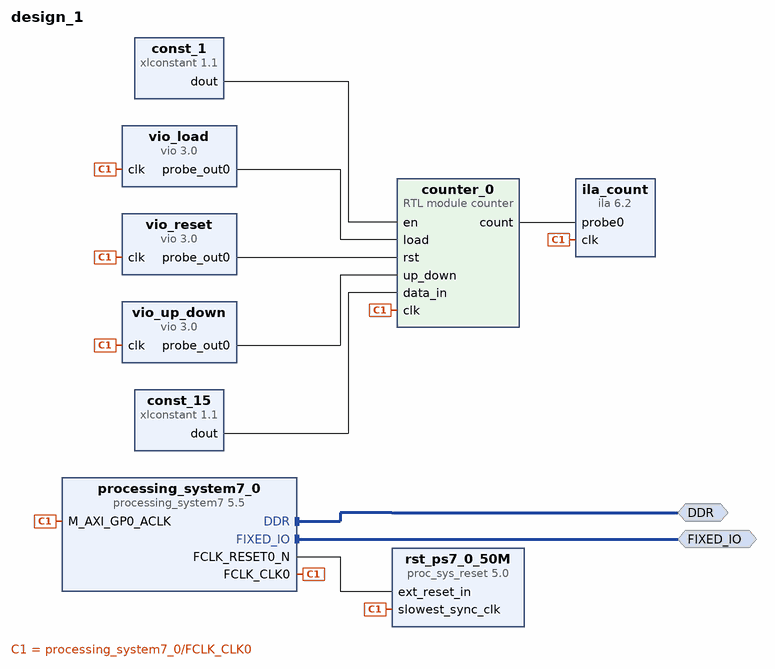
[diagram p0: block diagram of the top level]
# Vivado block design design_1, xc7z010clg400-1, Vivado 2026.1
create_bd_design design_1

create_bd_intf_port -mode Master -vlnv xilinx.com:interface:ddrx_rtl:1.0 DDR
create_bd_intf_port -mode Master -vlnv xilinx.com:display_processing_system7:fixedio_rtl:1.0 FIXED_IO

create_bd_cell -type module -reference counter counter_0
create_bd_cell -type ip -vlnv xilinx.com:ip:ila:6.2 ila_count
set_property -dict [list \
  CONFIG.C_EN_STRG_QUAL 1 \
  CONFIG.C_MONITOR_TYPE Native \
  CONFIG.C_NUM_OF_PROBES 1 \
  CONFIG.C_PROBE0_WIDTH 4 \
] [get_bd_cells ila_count]
create_bd_cell -type ip -vlnv xilinx.com:ip:xlconstant:1.1 const_1
create_bd_cell -type ip -vlnv xilinx.com:ip:xlconstant:1.1 const_15
set_property -dict {CONFIG.CONST_VAL 15 CONFIG.CONST_WIDTH 4} [get_bd_cells const_15]
create_bd_cell -type ip -vlnv xilinx.com:ip:vio:3.0 vio_up_down
set_property -dict {CONFIG.C_NUM_PROBE_IN 0} [get_bd_cells vio_up_down]
create_bd_cell -type ip -vlnv xilinx.com:ip:vio:3.0 vio_load
set_property -dict {CONFIG.C_NUM_PROBE_IN 0} [get_bd_cells vio_load]
create_bd_cell -type ip -vlnv xilinx.com:ip:processing_system7:5.5 processing_system7_0
# 1 more settings of processing_system7_0 are not shown: defaults, MIO pin electricals, DDR timing, and values the tool derives
create_bd_cell -type ip -vlnv xilinx.com:ip:proc_sys_reset:5.0 rst_ps7_0_50M
create_bd_cell -type ip -vlnv xilinx.com:ip:vio:3.0 vio_reset
set_property -dict {CONFIG.C_NUM_PROBE_IN 0} [get_bd_cells vio_reset]

# ---- connections ----

connect_bd_intf_net [get_bd_intf_ports DDR] [get_bd_intf_pins processing_system7_0/DDR]
connect_bd_intf_net [get_bd_intf_ports FIXED_IO] [get_bd_intf_pins processing_system7_0/FIXED_IO]
connect_bd_net -net clk_wiz_clk_out1 [get_bd_pins processing_system7_0/FCLK_CLK0] \
  [get_bd_pins counter_0/clk] [get_bd_pins ila_count/clk] [get_bd_pins vio_up_down/clk] [get_bd_pins vio_load/clk] \
  [get_bd_pins rst_ps7_0_50M/slowest_sync_clk] [get_bd_pins processing_system7_0/M_AXI_GP0_ACLK] [get_bd_pins vio_reset/clk]
connect_bd_net [get_bd_pins const_1/dout] [get_bd_pins counter_0/en]
connect_bd_net [get_bd_pins counter_0/count] [get_bd_pins ila_count/probe0]
connect_bd_net [get_bd_pins processing_system7_0/FCLK_RESET0_N] [get_bd_pins rst_ps7_0_50M/ext_reset_in]
connect_bd_net [get_bd_pins vio_load/probe_out0] [get_bd_pins counter_0/load]
connect_bd_net [get_bd_pins vio_reset/probe_out0] [get_bd_pins counter_0/rst]
connect_bd_net [get_bd_pins vio_up_down/probe_out0] [get_bd_pins counter_0/up_down]
connect_bd_net -net xlconstant_0_dout1 [get_bd_pins const_15/dout] [get_bd_pins counter_0/data_in]

validate_bd_design
save_bd_design
